# Altium schematic sheet Top-Sheet.SchDoc
size A; DocumentNumber: 1; SheetNumber: 1; SheetTotal: 5
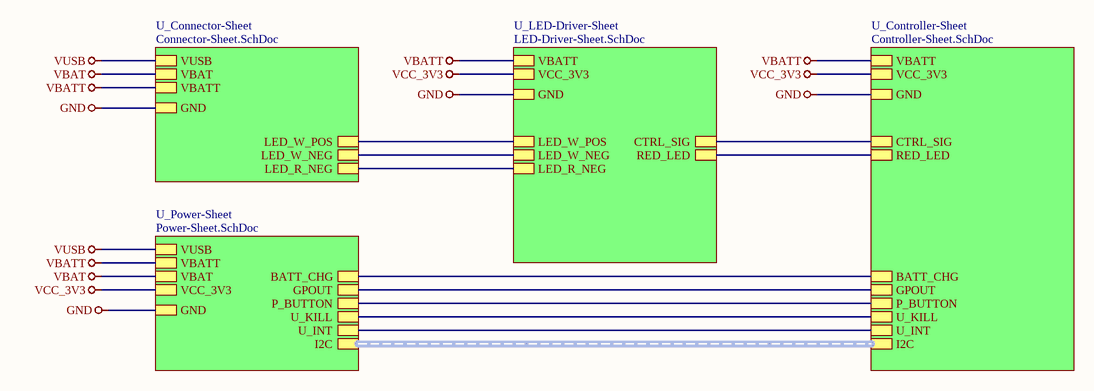
[diagram p0: Top-Sheet.SchDoc]

## Sub-sheets
U_Connector-Sheet = Connector-Sheet.SchDoc: VUSB, LED_W_POS, LED_W_NEG, LED_R_NEG, GND, VBATT, VBAT
U_Controller-Sheet = Controller-Sheet.SchDoc: GND, VCC_3V3, RED_LED, CTRL_SIG, P_BUTTON, I2C (harness I2C), GPOUT, VBATT, U_KILL, U_INT, BATT_CHG
U_LED-Driver-Sheet = LED-Driver-Sheet.SchDoc: GND, VCC_3V3, RED_LED, CTRL_SIG, VBATT, LED_W_POS, LED_W_NEG, LED_R_NEG
U_Power-Sheet = Power-Sheet.SchDoc: GND, VCC_3V3, VUSB, VBATT, I2C (harness I2C), GPOUT, P_BUTTON, U_KILL, U_INT, BATT_CHG, VBAT

## Nets
GND: sheet U_Connector-Sheet/GND, sheet U_Controller-Sheet/GND, sheet U_LED-Driver-Sheet/GND, sheet U_Power-Sheet/GND
VBAT: sheet U_Connector-Sheet/VBAT, sheet U_Power-Sheet/VBAT
VBATT: sheet U_Connector-Sheet/VBATT, sheet U_Controller-Sheet/VBATT, sheet U_LED-Driver-Sheet/VBATT, sheet U_Power-Sheet/VBATT
VCC_3V3: sheet U_Controller-Sheet/VCC_3V3, sheet U_LED-Driver-Sheet/VCC_3V3, sheet U_Power-Sheet/VCC_3V3
VUSB: sheet U_Connector-Sheet/VUSB, sheet U_Power-Sheet/VUSB
(unnamed): sheet U_Connector-Sheet/LED_W_POS, sheet U_LED-Driver-Sheet/LED_W_POS
(unnamed): sheet U_Connector-Sheet/LED_W_NEG, sheet U_LED-Driver-Sheet/LED_W_NEG
(unnamed): sheet U_Connector-Sheet/LED_R_NEG, sheet U_LED-Driver-Sheet/LED_R_NEG
(unnamed): sheet U_Controller-Sheet/RED_LED, sheet U_LED-Driver-Sheet/RED_LED
(unnamed): sheet U_Controller-Sheet/CTRL_SIG, sheet U_LED-Driver-Sheet/CTRL_SIG
(unnamed): sheet U_Controller-Sheet/P_BUTTON, sheet U_Power-Sheet/P_BUTTON
(unnamed): sheet U_Controller-Sheet/GPOUT, sheet U_Power-Sheet/GPOUT
(unnamed): sheet U_Controller-Sheet/U_KILL, sheet U_Power-Sheet/U_KILL
(unnamed): sheet U_Controller-Sheet/U_INT, sheet U_Power-Sheet/U_INT
(unnamed): sheet U_Controller-Sheet/BATT_CHG, sheet U_Power-Sheet/BATT_CHG

## Buses and harness runs
harness sheet U_Controller-Sheet/I2C = sheet U_Power-Sheet/I2C